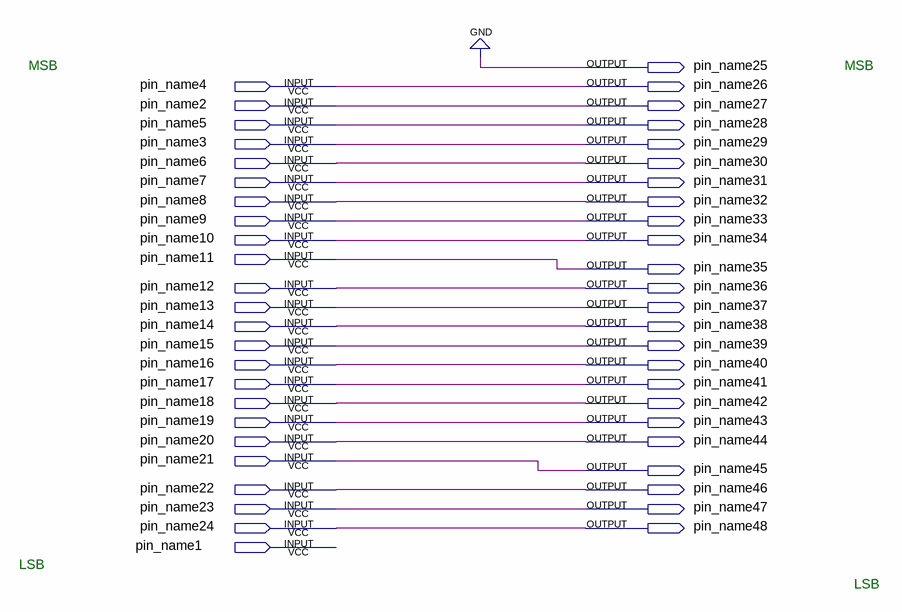
[diagram p0: schematic sheet]
// Quartus schematic downshift24b.bdf as structural Verilog: 0 symbols, 48 pins
module downshift24b (
  input  pin_name4,
  input  pin_name2,
  input  pin_name5,
  input  pin_name3,
  input  pin_name6,
  input  pin_name7,
  input  pin_name8,
  input  pin_name9,
  input  pin_name10,
  input  pin_name11,
  input  pin_name12,
  input  pin_name13,
  input  pin_name14,
  input  pin_name15,
  input  pin_name16,
  input  pin_name17,
  input  pin_name18,
  input  pin_name19,
  input  pin_name20,
  input  pin_name21,
  input  pin_name22,
  input  pin_name23,
  input  pin_name24,
  input  pin_name1,
  output pin_name25,
  output pin_name26,
  output pin_name27,
  output pin_name28,
  output pin_name29,
  output pin_name30,
  output pin_name31,
  output pin_name32,
  output pin_name33,
  output pin_name34,
  output pin_name35,
  output pin_name36,
  output pin_name37,
  output pin_name38,
  output pin_name39,
  output pin_name40,
  output pin_name41,
  output pin_name42,
  output pin_name43,
  output pin_name44,
  output pin_name45,
  output pin_name46,
  output pin_name47,
  output pin_name48
);


  assign pin_name25 = 1'b0;
  assign pin_name26 = pin_name4;
  assign pin_name27 = pin_name2;
  assign pin_name28 = pin_name5;
  assign pin_name29 = pin_name3;
  assign pin_name30 = pin_name6;
  assign pin_name31 = pin_name7;
  assign pin_name32 = pin_name8;
  assign pin_name33 = pin_name9;
  assign pin_name34 = pin_name10;
  assign pin_name35 = pin_name11;
  assign pin_name36 = pin_name12;
  assign pin_name37 = pin_name13;
  assign pin_name38 = pin_name14;
  assign pin_name39 = pin_name15;
  assign pin_name40 = pin_name16;
  assign pin_name41 = pin_name17;
  assign pin_name42 = pin_name18;
  assign pin_name43 = pin_name19;
  assign pin_name44 = pin_name20;
  assign pin_name45 = pin_name21;
  assign pin_name46 = pin_name22;
  assign pin_name47 = pin_name23;
  assign pin_name48 = pin_name24;

  // Notes on the sheet:
  //   MSB
  //   MSB
  //   LSB
  //   LSB
endmodule
